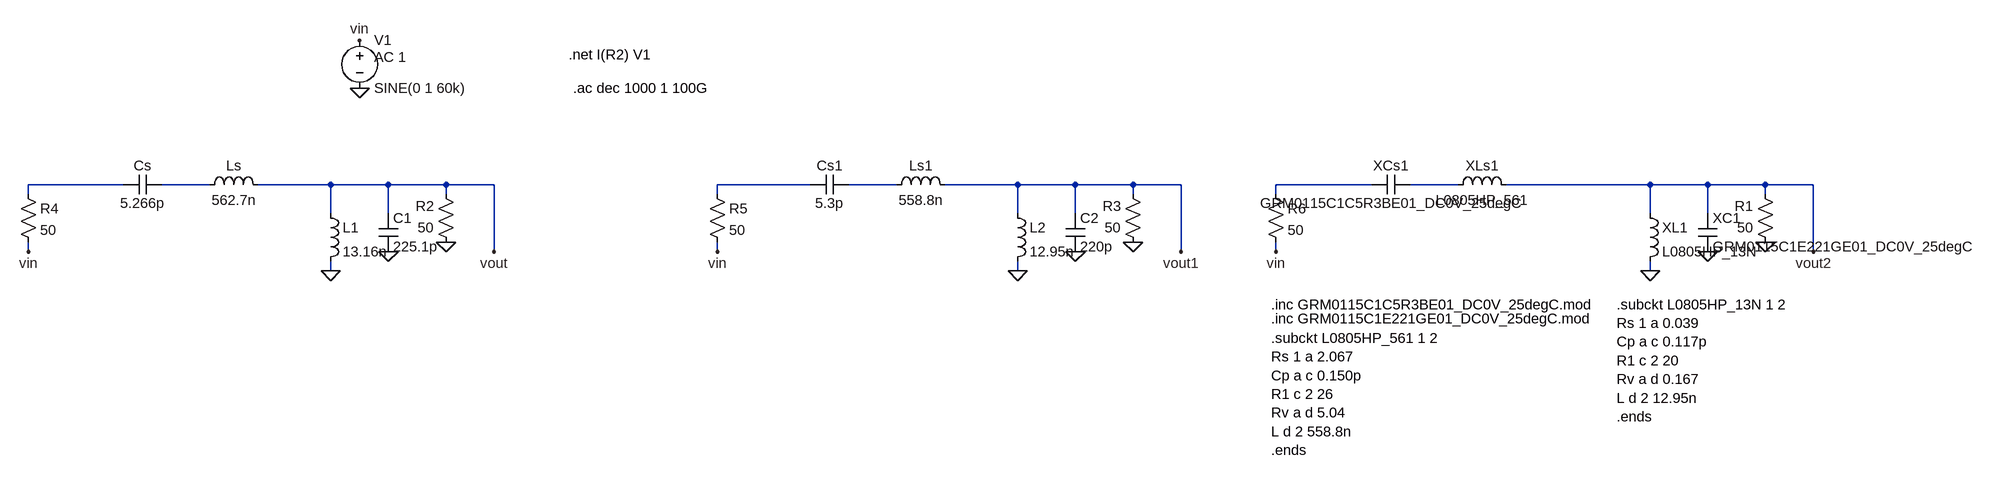
[diagram p0: schematic Filtro.asc]
Filtro.asc, the LTspice schematic file:
Version 4.1
SHEET 1 3460 904
WIRE -16 144 -176 144
WIRE 128 144 48 144
WIRE 448 144 208 144
WIRE 544 144 448 144
WIRE 640 144 544 144
WIRE 720 144 640 144
WIRE 1264 144 1104 144
WIRE 1408 144 1328 144
WIRE 1728 144 1488 144
WIRE 1824 144 1728 144
WIRE 1920 144 1824 144
WIRE 2000 144 1920 144
WIRE 2448 144 2288 144
WIRE 2592 144 2512 144
WIRE 2912 144 2672 144
WIRE 3008 144 2912 144
WIRE 3104 144 3008 144
WIRE 3184 144 3104 144
WIRE -176 160 -176 144
WIRE 640 160 640 144
WIRE 1104 160 1104 144
WIRE 1920 160 1920 144
WIRE 2288 160 2288 144
WIRE 3104 160 3104 144
WIRE 448 192 448 144
WIRE 544 192 544 144
WIRE 1728 192 1728 144
WIRE 1824 192 1824 144
WIRE 2912 192 2912 144
WIRE 3008 192 3008 144
WIRE -176 256 -176 240
WIRE 720 256 720 144
WIRE 1104 256 1104 240
WIRE 2000 256 2000 144
WIRE 2288 256 2288 240
WIRE 3184 256 3184 144
WIRE 448 288 448 272
WIRE 1728 288 1728 272
WIRE 2912 288 2912 272
FLAG 448 288 0
FLAG 720 256 vout
FLAG -176 256 vin
FLAG 496 -48 0
FLAG 496 -128 vin
FLAG 544 256 0
FLAG 640 240 0
FLAG 2912 288 0
FLAG 3184 256 vout2
FLAG 2288 256 vin
FLAG 3008 256 0
FLAG 3104 240 0
FLAG 1728 288 0
FLAG 2000 256 vout1
FLAG 1104 256 vin
FLAG 1824 256 0
FLAG 1920 240 0
DATAFLAG 1104 160 ""
DATAFLAG 704 144 ""
DATAFLAG 720 144 ""
SYMBOL ind 112 160 R270
WINDOW 0 32 56 VTop 2
WINDOW 3 5 56 VBottom 2
SYMATTR InstName Ls
SYMATTR Value 562.7n
SYMBOL cap -16 160 R270
WINDOW 0 32 32 VTop 2
WINDOW 3 0 32 VBottom 2
SYMATTR InstName Cs
SYMATTR Value 5.266p
SYMBOL ind 432 176 R0
SYMATTR InstName L1
SYMATTR Value 13.16n
SYMBOL cap 528 256 M180
WINDOW 0 24 56 Left 2
WINDOW 3 24 8 Left 2
SYMATTR InstName C1
SYMATTR Value 225.1p
SYMBOL voltage 496 -144 R0
WINDOW 123 24 44 Left 2
WINDOW 39 0 0 Left 0
SYMATTR Value2 AC 1
SYMATTR InstName V1
SYMATTR Value SINE(0 1 60k)
SYMBOL res 656 256 R180
WINDOW 0 36 76 Left 2
WINDOW 3 36 40 Left 2
SYMATTR InstName R2
SYMATTR Value 50
SYMBOL ind 2576 160 R270
WINDOW 0 32 56 VTop 2
WINDOW 3 5 56 VBottom 2
SYMATTR InstName XLs1
SYMATTR Value L0805HP_561
SYMATTR Prefix X
SYMBOL cap 2448 160 R270
WINDOW 0 32 32 VTop 2
WINDOW 3 0 32 VBottom 2
SYMATTR InstName XCs1
SYMATTR Value GRM0115C1C5R3BE01_DC0V_25degC
SYMATTR Prefix X
SYMBOL ind 2896 176 R0
SYMATTR InstName XL1
SYMATTR Value L0805HP_13N
SYMATTR Prefix X
SYMBOL cap 2992 256 M180
WINDOW 0 24 56 Left 2
WINDOW 3 24 8 Left 2
SYMATTR InstName XC1
SYMATTR Value GRM0115C1E221GE01_DC0V_25degC
SYMATTR Prefix X
SYMBOL res 3120 256 R180
WINDOW 0 36 76 Left 2
WINDOW 3 36 40 Left 2
SYMATTR InstName R1
SYMATTR Value 50
SYMBOL ind 1392 160 R270
WINDOW 0 32 56 VTop 2
WINDOW 3 5 56 VBottom 2
SYMATTR InstName Ls1
SYMATTR Value 558.8n
SYMBOL cap 1264 160 R270
WINDOW 0 32 32 VTop 2
WINDOW 3 0 32 VBottom 2
SYMATTR InstName Cs1
SYMATTR Value 5.3p
SYMBOL ind 1712 176 R0
SYMATTR InstName L2
SYMATTR Value 12.95n
SYMBOL cap 1808 256 M180
WINDOW 0 24 56 Left 2
WINDOW 3 24 8 Left 2
SYMATTR InstName C2
SYMATTR Value 220p
SYMBOL res 1936 256 R180
WINDOW 0 36 76 Left 2
WINDOW 3 36 40 Left 2
SYMATTR InstName R3
SYMATTR Value 50
SYMBOL res -192 144 R0
SYMATTR InstName R4
SYMATTR Value 50
SYMBOL res 1088 144 R0
SYMATTR InstName R5
SYMATTR Value 50
SYMBOL res 2272 144 R0
SYMATTR InstName R6
SYMATTR Value 50
TEXT 864 -48 Left 2 !.ac dec 1000 1 100G
TEXT 856 -104 Left 2 !.net I(R2) V1
TEXT 2280 344 Left 2 !.inc GRM0115C1C5R3BE01_DC0V_25degC.mod
TEXT 2280 368 Left 2 !.inc GRM0115C1E221GE01_DC0V_25degC.mod
TEXT 2280 400 Left 2 !.subckt L0805HP_561 1 2\nRs 1 a 2.067\nCp a c 0.150p\nR1 c 2 26\nRv a d 5.04\nL d 2 558.8n\n.ends
TEXT 2856 344 Left 2 !.subckt L0805HP_13N 1 2\nRs 1 a 0.039\nCp a c 0.117p\nR1 c 2 20\nRv a d 0.167\nL d 2 12.95n\n.ends

The netlist it stands for:
* Filtro.asc
Ls N002 vout 562.7n
Cs N001 N002 5.266p
L1 vout 0 13.16n
C1 0 vout 225.1p
V1 vin 0 SINE(0 1 60k) AC 1
R2 0 vout 50
X§XLs1 N006 vout2 L0805HP_561  ; pins A B
X§XCs1 N005 N006 GRM0115C1C5R3BE01_DC0V_25degC  ; pins A B
X§XL1 vout2 0 L0805HP_13N  ; pins A B
X§XC1 0 vout2 GRM0115C1E221GE01_DC0V_25degC  ; pins A B
R1 0 vout2 50
Ls1 N004 vout1 558.8n
Cs1 N003 N004 5.3p
L2 vout1 0 12.95n
C2 0 vout1 220p
R3 0 vout1 50
R4 N001 vin 50
R5 N003 vin 50
R6 N005 vin 50
.ac dec 1000 1 100G
.net I(R2) V1
.inc GRM0115C1C5R3BE01_DC0V_25degC.mod
.inc GRM0115C1E221GE01_DC0V_25degC.mod
.subckt L0805HP_561 1 2
Rs 1 a 2.067
Cp a c 0.150p
R1 c 2 26
Rv a d 5.04
L d 2 558.8n
.ends
.subckt L0805HP_13N 1 2
Rs 1 a 0.039
Cp a c 0.117p
R1 c 2 20
Rv a d 0.167
L d 2 12.95n
.ends
.backanno
.end

* Results of the author's LTspice run, read from the files saved beside the schematic
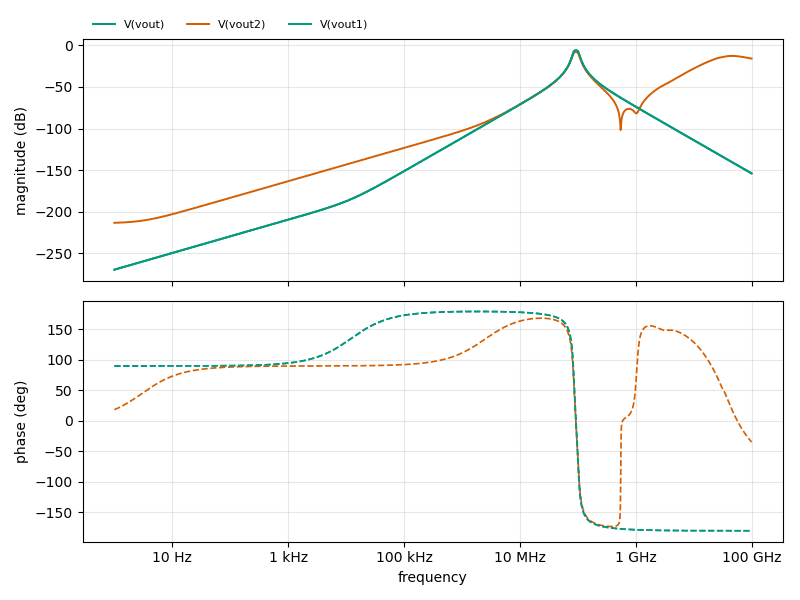
[diagram p1: AC Analysis of Filtro.asc, plotted from the saved traces]
* AC Analysis, 1 run:
*   V(vout): -269.61 dB at 1 Hz, -153.98 dB at 100 GHz, peak -6.02 dB at 92.68 MHz, 3 dB below the peak at 83 MHz and 103 MHz
*   V(vout2): -213.26 dB at 1 Hz, -15.86 dB at 100 GHz, peak -7.84 dB at 92.47 MHz, 3 dB below the peak at 83.05 MHz and 103.1 MHz
*   V(vout1): -269.55 dB at 1 Hz, -153.72 dB at 100 GHz, peak -6.09 dB at 94.41 MHz, 3 dB below the peak at 83.71 MHz and 104.2 MHz